# EAGLE design capacitor-board (EAGLE 6.1)
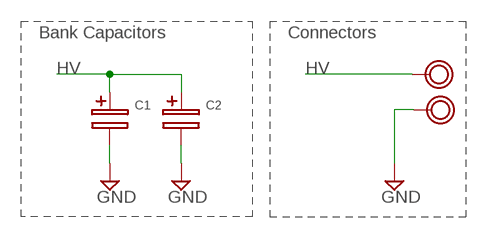
[diagram p0: schematic, sheet 1]

## Parts
C1  RC_CAPHORIZ  [25MM-DIA_HORIZ]
C2  RC_CAPHORIZ  [25MM-DIA_HORIZ]
U$1  VIA_TP  [VIA_2MM]
U$3  VIA_TP  [VIA_2MM]

## Nets
GND: C1.- C2.- U$3.P$1
HV: C1.+ C2.+ U$1.P$1

## Notes on the sheet
- Bank Capacitors | Connectors

## Library data of the parts
C1 C2 = RoboJackets-Capacitors:RC_CAP
U$1 U$3 = RoboJackets-Connectors:VIA_TP

## Board
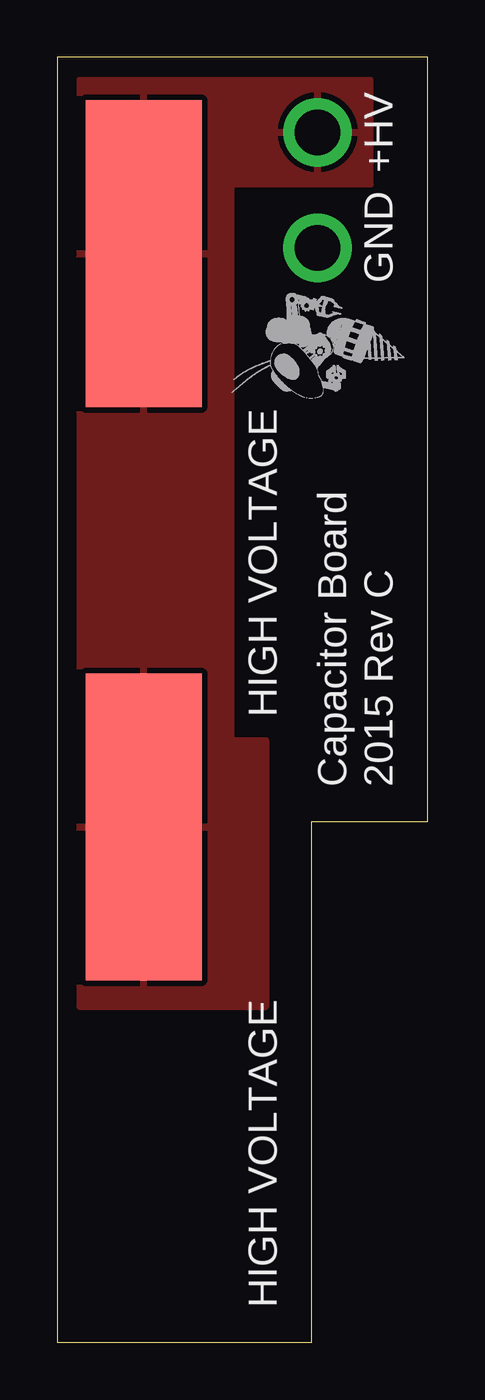
[diagram p1: board, top side]
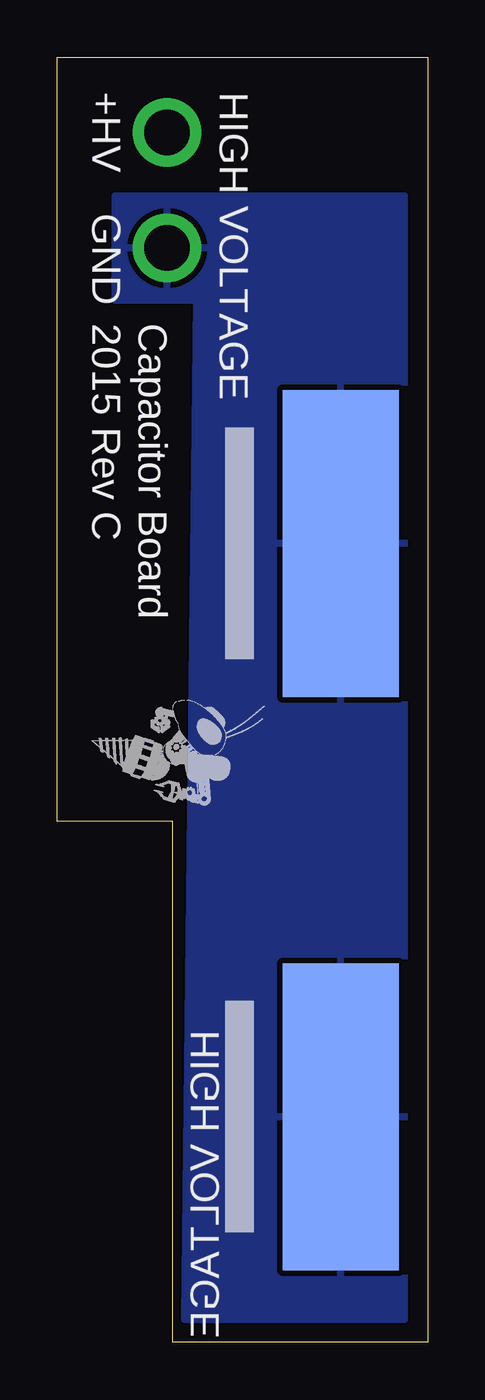
[diagram p2: board, bottom side, seen from below]

Size 16.26 x 56.39 mm. Coordinates in mm from the lower left corner, seen from the top.
Outline: 0,0 11.18,0 11.18,22.86 16.26,22.86 16.26,56.39 0,56.39 0,0
Copper layers (1*16): Top 0.0356mm / dielectric 63mil / Bottom 0.0356mm
Design rules "default": minimum track width 6mil, minimum drill 15mil, track to track 6mil, track to pad 6mil, pad to pad 6mil, via to via 6mil, smd to smd 6mil, copper to edge 0mil, drill to drill 6mil, minimum pad ring 10mil, minimum via ring 8mil, stop-mask expansion 4mil, vias tented up to drill 0mil, thermal gap 10mil

### Footprints (pad centres in the part's own frame; a part is rotated, then mirrored left to right if it is on the bottom)
25MM-DIA_HORIZ = smd 13.462 x 5.08: + -6.35,0 | smd 13.462 x 5.08 bottom: - 6.35,0
VIA_2MM = drill 2: P$1 0,0

### Placement (x,y rotation side)
C1  3.81,16.26 270 top
C2  3.81,41.4 270 top
U$1  11.43,53.09 0 top
U$2  [ROBOBUZZ_0.4X]  14.73,26.42 270 bottom
U$3  11.43,48.01 0 top
U$4  [ROBOBUZZ_0.4X]  15.24,43.18 90 top

### Tracks (layer width: path | path; a pad name or v marks a point on that pad's centre or on a via)
GND
  pour Bottom (isolate 0.508): 1.02,50.29 13.72,50.29 13.72,45.72 10.16,45.72 10.67,1.02 1.02,1.02
HV
  pour Top: 1.02,55.37 13.72,55.37 13.72,50.8 7.62,50.8 7.62,26.42 9.14,26.42 9.14,14.73 1.02,14.73

### Text on the board
tPlace: +HV | GND | HIGH VOLTAGE | Capacitor Board | 2015 Rev C | HIGH VOLTAGE
bPlace: HIGH VOLTAGE | +HV | GND | Capacitor Board | 2015 Rev C | HIGH VOLTAGE
Notes: The Capacitor Board exists just / as a holding place for the two / 820uF capacitors. This board is / connected directly to the HV and / GND of the Kicker board. There / should be two per Kicker board.